# Altium schematic sheet PCB-MAIN_07_BLE.SchDoc
size 594 x 420 mm
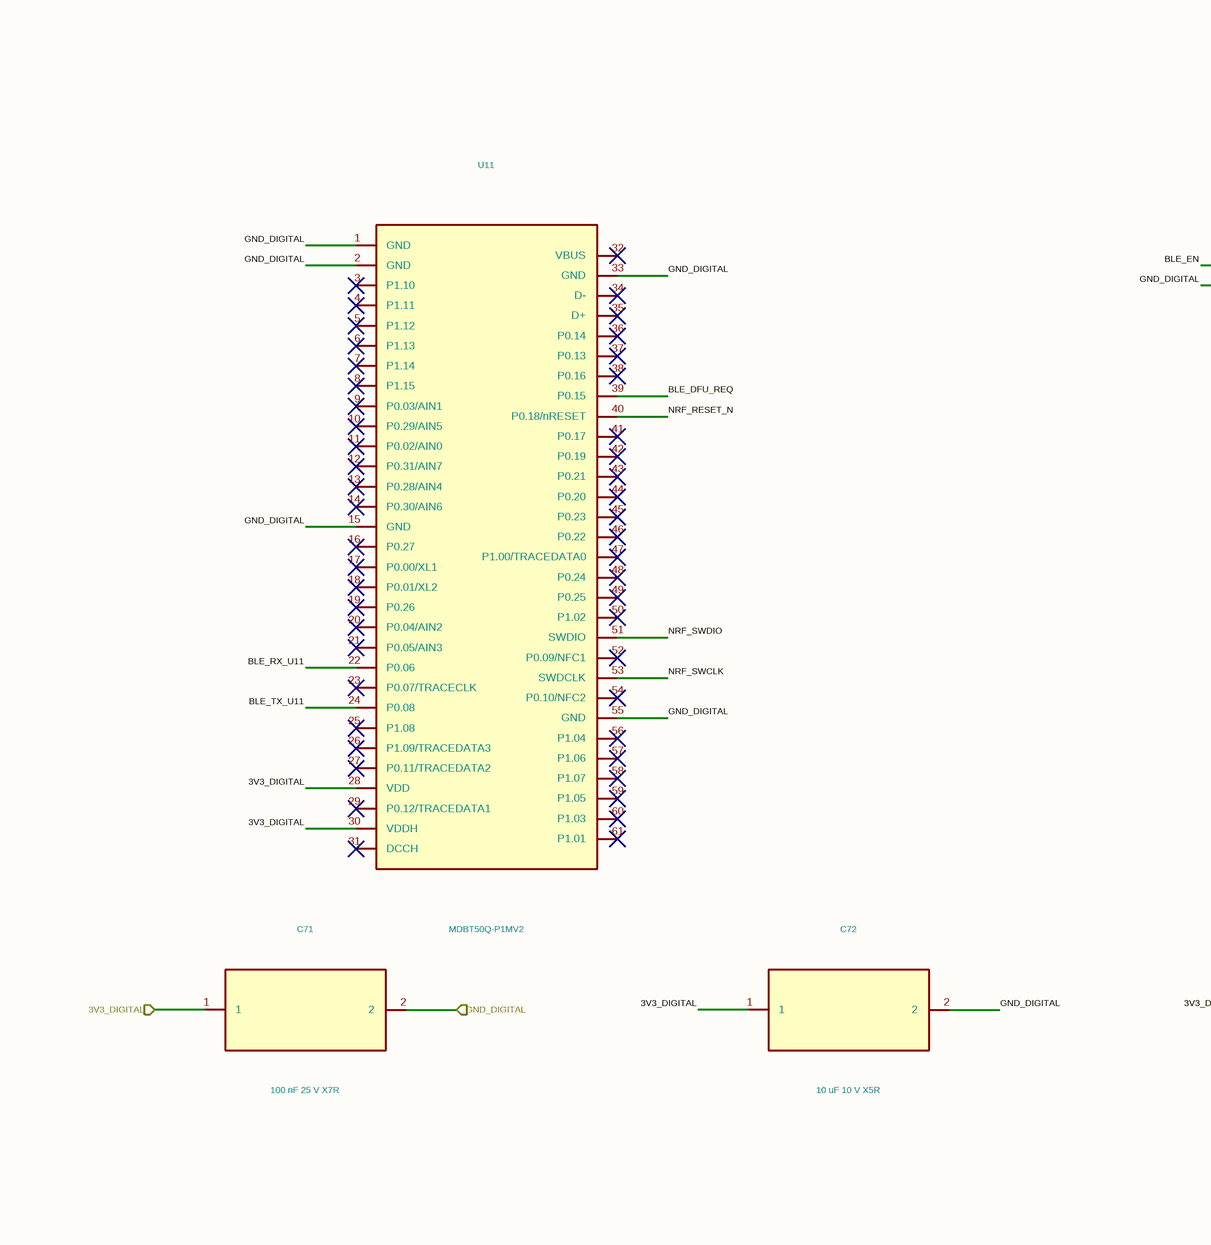
[diagram p0: PCB-MAIN_07_BLE.SchDoc, top left]
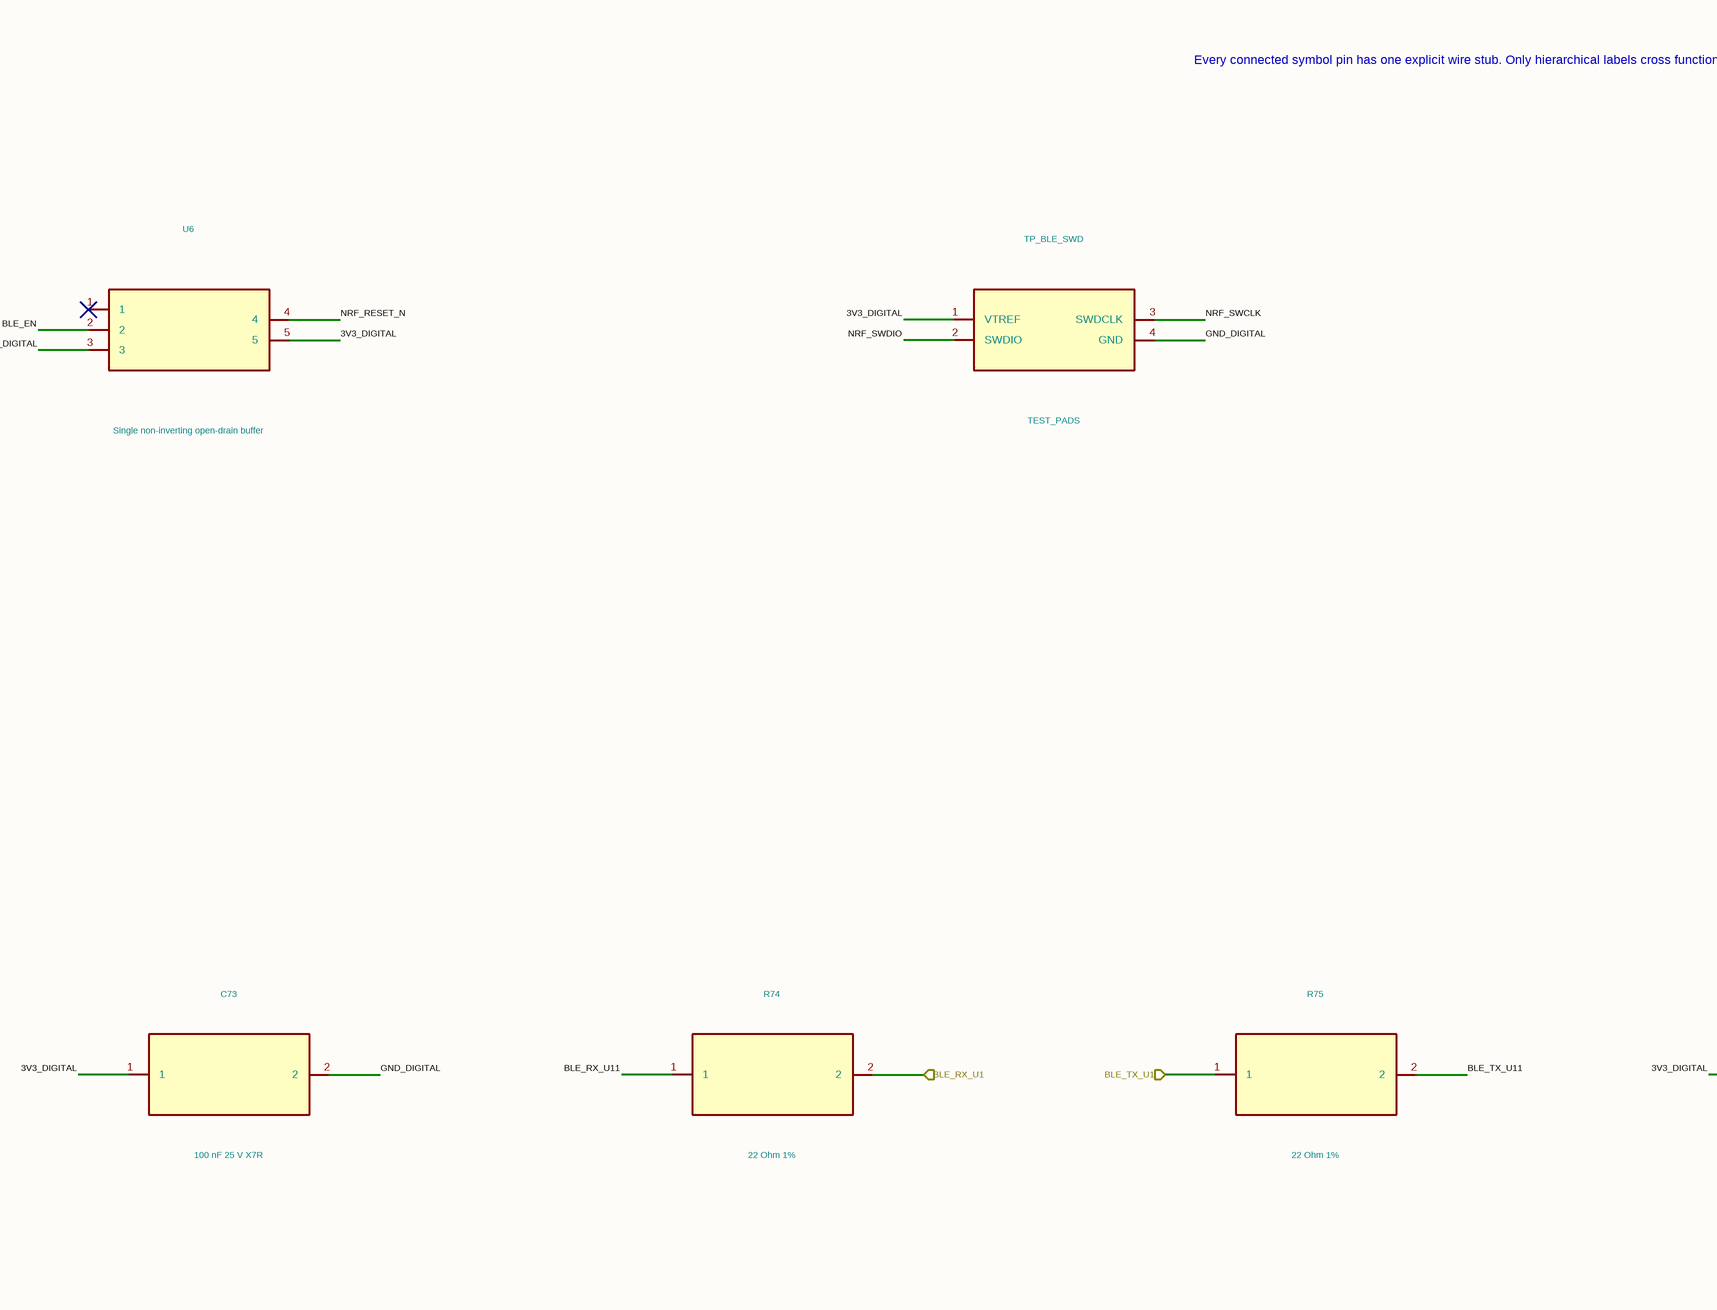
[diagram p1: PCB-MAIN_07_BLE.SchDoc, top middle]
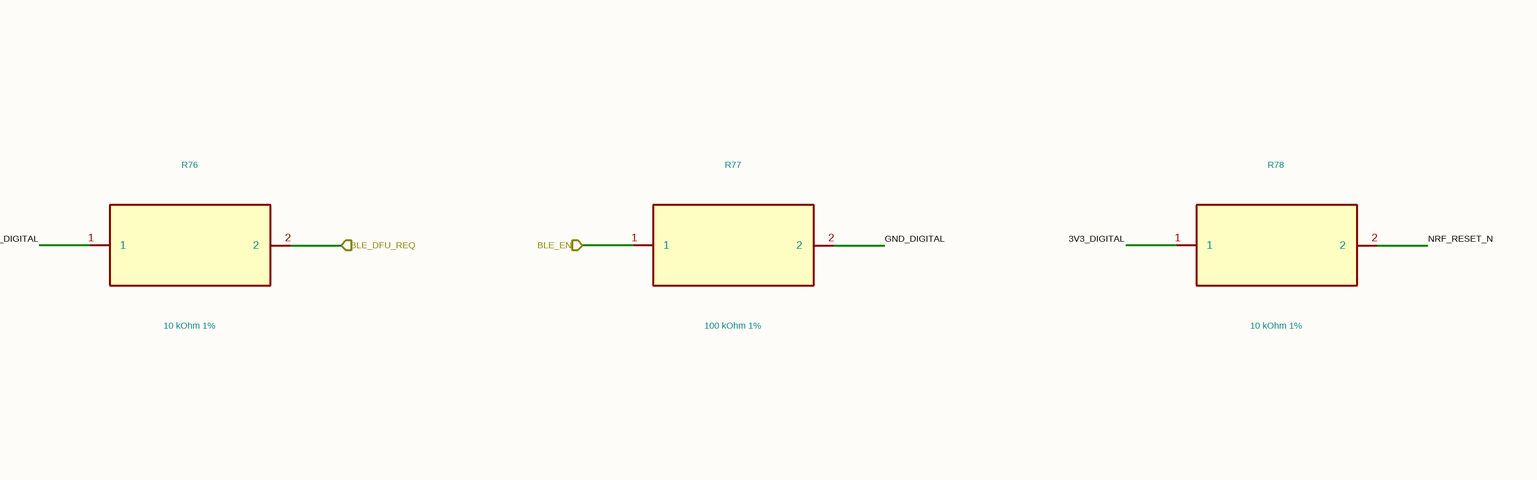
[diagram p2: PCB-MAIN_07_BLE.SchDoc, top right]
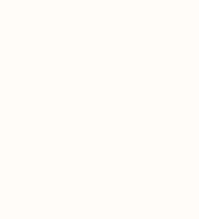
[diagram p3: PCB-MAIN_07_BLE.SchDoc, bottom left]

## Parts
C71  100 nF 25 V X7R  [C_0402_1005Metric]
C72  10 uF 10 V X5R  [C_0603_1608Metric]
C73  100 nF 25 V X7R  [C_0402_1005Metric]
R74  22 Ohm 1%  [R_0402_1005Metric]
R75  22 Ohm 1%  [R_0402_1005Metric]
R76  10 kOhm 1%  [R_0402_1005Metric]
R77  100 kOhm 1%  [R_0402_1005Metric]
R78  10 kOhm 1%  [R_0402_1005Metric]
TP_BLE_SWD  TEST_PADS
U6  Single non-inverting open-drain buffer
U11  MDBT50Q-P1MV2

## Ports
3V3_DIGITAL, BLE_DFU_REQ, BLE_EN, BLE_RX_U1, BLE_TX_U1, GND_DIGITAL

## Nets
3V3_DIGITAL: C71.1 ; port 3V3_DIGITAL
3V3_DIGITAL: C72.1 C73.1 R76.1 R78.1 TP_BLE_SWD.1(VTREF) U6.5 U11.28(VDD) U11.30(VDDH)  [a separate net that carries the same name]
BLE_DFU_REQ: R76.2 ; port BLE_DFU_REQ
BLE_DFU_REQ: U11.39(P0.15)  [a separate net that carries the same name]
BLE_EN: R77.1 ; port BLE_EN
BLE_EN: U6.2  [a separate net that carries the same name]
BLE_RX_U1: R74.2 ; port BLE_RX_U1
BLE_RX_U11: R74.1 U11.22(P0.06)
BLE_TX_U1: R75.1 ; port BLE_TX_U1
BLE_TX_U11: R75.2 U11.24(P0.08)
GND_DIGITAL: C71.2 ; port GND_DIGITAL
GND_DIGITAL: C72.2 C73.2 R77.2 TP_BLE_SWD.4(GND) U6.3 U11.1(GND) U11.2(GND) U11.15(GND) U11.33(GND) U11.55(GND)  [a separate net that carries the same name]
NRF_RESET_N: R78.2 U6.4 U11.40(P0.18/nRESET)
NRF_SWCLK: TP_BLE_SWD.3(SWDCLK) U11.53(SWDCLK)
NRF_SWDIO: TP_BLE_SWD.2(SWDIO) U11.51(SWDIO)

Not connected (* = marked no-connect by the designer): U6 1*; U11 3(P1.10)* 4(P1.11)* 5(P1.12)* 6(P1.13)* 7(P1.14)* 8(P1.15)* 9(P0.03/AIN1)* 10(P0.29/AIN5)* 11(P0.02/AIN0)* 12(P0.31/AIN7)* 13(P0.28/AIN4)* 14(P0.30/AIN6)* 16(P0.27)* 17(P0.00/XL1)* 18(P0.01/XL2)* 19(P0.26)* 20(P0.04/AIN2)* 21(P0.05/AIN3)* 23(P0.07/TRACECLK)* 25(P1.08)* 26(P1.09/TRACEDATA3)* 27(P0.11/TRACEDATA2)* 29(P0.12/TRACEDATA1)* 31(DCCH)* 32(VBUS)* 34(D-)* 35(D+)* 36(P0.14)* 37(P0.13)* 38(P0.16)* 41(P0.17)* 42(P0.19)* 43(P0.21)* 44(P0.20)* 45(P0.23)* 46(P0.22)* 47(P1.00/TRACEDATA0)* 48(P0.24)* 49(P0.25)* 50(P1.02)* 52(P0.09/NFC1)* 54(P0.10/NFC2)* 56(P1.04)* 57(P1.06)* 58(P1.07)* 59(P1.05)* 60(P1.03)* 61(P1.01)*

## Notes on the sheet
- Every connected symbol pin has one explicit wire stub. Only hierarchical labels cross functional-sheet boundaries.
- 1
- 2
- 3
- 4
- 5
- 6
- 7
- 8
- 9
- 10
- 11
- A
- B
- C
- D
- E
- F
- G
- H
- Human-readable hierarchy candidate; exact Review-A pin/net equivalence enforced
- Functional sheet 8 of 10
- NOT FOR MANUFACTURE - hierarchy review/routing/DRC/DFM/Review B pending
- Title: Dioneya PCB-MAIN Rev.A - BLE
- File: PCB-MAIN_07_BLE.kicad_sch
- Sheet: /
- Dioneya / ZS-BPLA
- KiCad E.D.A.  kicad (5.1.4)-1
- Size: A2
- Date: 2026-09-16
- Rev: A
- Id: 1/1

## Library data of the parts
C71 = C71_GRM155R71E104KE14D: Manufacturer: Murata; Population: FITTED; Authority: Raytac_MDBT50Q_Spec_Version_L; MPN: GRM155R71E104KE14D; Package: 0402; Value: 100 nF 25 V X7R; Footprint: Capacitor_SMD:C_0402_1005Metric
C72 = C72_GRM188R61A106KE69D: Manufacturer: Murata; Population: FITTED; Authority: Raytac_MDBT50Q_Spec_Version_L; MPN: GRM188R61A106KE69D; Package: 0603; Value: 10 uF 10 V X5R; Footprint: Capacitor_SMD:C_0603_1608Metric
C73 = C73_GRM155R71E104KE14D: Manufacturer: Murata; Population: FITTED; Authority: TI_SN74LVC1G07_datasheet; MPN: GRM155R71E104KE14D; Package: 0402; Value: 100 nF 25 V X7R; Footprint: Capacitor_SMD:C_0402_1005Metric
R74 = R74_ERJ-2RKF22R0X: Manufacturer: Panasonic; Population: FITTED; Authority: Raytac_MDBT50Q_Spec_Version_L; MPN: ERJ-2RKF22R0X; Package: 0402; Value: 22 Ohm 1%; Footprint: Resistor_SMD:R_0402_1005Metric
R75 = R75_ERJ-2RKF22R0X: Manufacturer: Panasonic; Population: FITTED; Authority: Raytac_MDBT50Q_Spec_Version_L; MPN: ERJ-2RKF22R0X; Package: 0402; Value: 22 Ohm 1%; Footprint: Resistor_SMD:R_0402_1005Metric
R76 = R76_ERJ-2RKF1002X: Manufacturer: Panasonic; Population: FITTED; Authority: Raytac_MDBT50Q_Spec_Version_L; MPN: ERJ-2RKF1002X; Package: 0402; Value: 10 kOhm 1%; Footprint: Resistor_SMD:R_0402_1005Metric
R77 = R77_ERJ-2RKF1003X: Manufacturer: Panasonic; Population: FITTED; Authority: TI_SN74LVC1G07_datasheet; MPN: ERJ-2RKF1003X; Package: 0402; Value: 100 kOhm 1%; Footprint: Resistor_SMD:R_0402_1005Metric
R78 = R78_ERJ-2RKF1002X: Manufacturer: Panasonic; Population: FITTED; Authority: TI_SN74LVC1G07_datasheet; MPN: ERJ-2RKF1002X; Package: 0402; Value: 10 kOhm 1%; Footprint: Resistor_SMD:R_0402_1005Metric
TP_BLE_SWD = TP_BLE_SWD_TEST_PADS: Manufacturer: CONTROLLED_AUTHORITY; Population: FITTED; Authority: PCB_MAIN_BLE_PIN_AUTHORITY_REV_A.csv; MPN: TEST_PADS; Package: POGO_FIXTURE_4P; Value: TEST_PADS
U6 = U6_SN74LVC1G07DBVR: Manufacturer: Texas Instruments; Population: FITTED; Authority: TI_SN74LVC1G07_datasheet; MPN: SN74LVC1G07DBVR; Package: SOT-23-5_DBV; Value: Single non-inverting open-drain buffer
U11 = U11_MDBT50Q-P1MV2: Manufacturer: Raytac; Population: FITTED; Authority: PCB_MAIN_BLE_PIN_AUTHORITY_REV_A.csv; MPN: MDBT50Q-P1MV2; Package: nRF52840_SMD_10.5x15.5_61P_PCB_antenna; Value: MDBT50Q-P1MV2